# Altium schematic sheet Sheet2.SchDoc
size A4; SheetNumber: 2; SheetTotal: 3
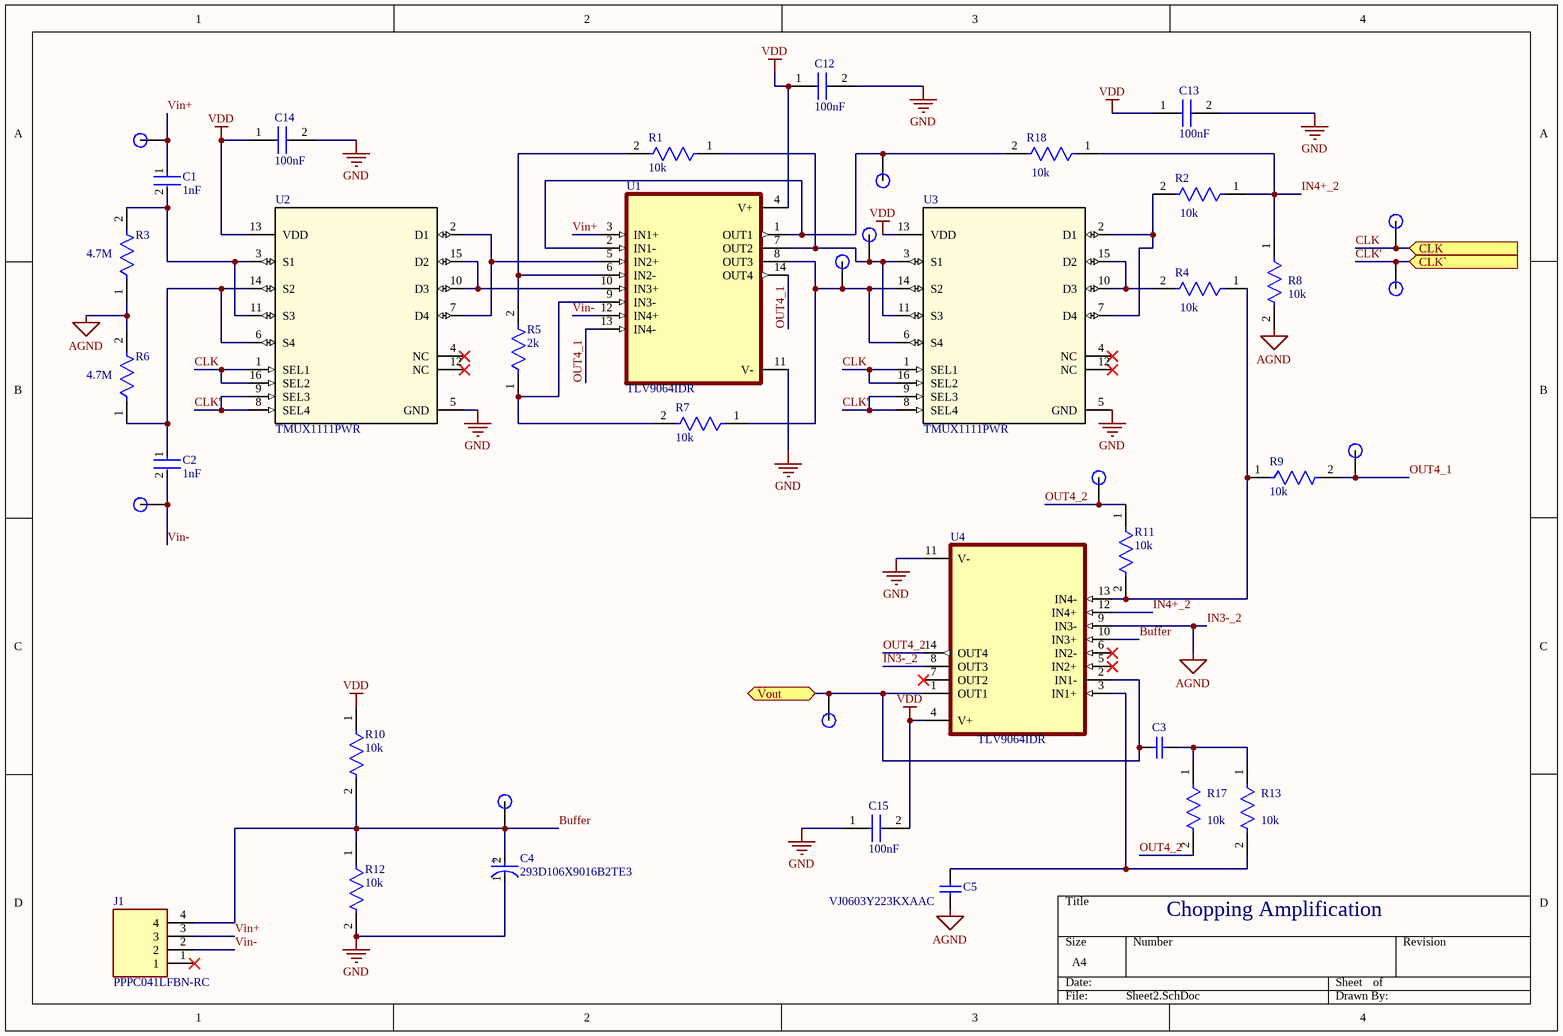
[diagram p0: Sheet2.SchDoc]

## Parts
C1  1nF  [FP-CC0603-DA-MFG]
C2  1nF  [FP-CC0603-DA-MFG]
C3  VJ0603Y473KXAAC  [CAPC1608X92X38NL15T08]  (value not drawn)
C4  293D106X9016B2TE3  [FP-293D-B-MFG]
C5  VJ0603Y223KXAAC  [CAPC1608X92X38ML15T08]
C12  100nF  [CAPC1005X55N]
C13  100nF  [CAPC1005X55N]
C14  100nF  [CAPC1005X55N]
C15  100nF  [CAPC1005X55N]
J1  PPPC041LFBN-RC  [RHDR4W80P0X254_1X4_1066X254X850P]
R1  10k  [FP-AC0603-IPC_A]
R2  10k  [FP-AC0603-IPC_A]
R3  4.7M  [FP-ESR03-MFG]
R4  10k  [FP-AC0603-IPC_A]
R5  2k  [FP-RN732A-MFG]
R6  4.7M  [FP-ESR03-MFG]
R7  10k  [FP-AC0603-IPC_A]
R8  10k  [FP-AC0603-IPC_A]
R9  10k  [FP-AC0603-IPC_A]
R10  10k  [FP-AC0603-IPC_A]
R11  10k  [FP-AC0603-IPC_A]
R12  10k  [FP-AC0603-IPC_A]
R13  10k  [FP-AC0603-IPC_A]
R17  10k  [FP-AC0603-IPC_A]
R18  10k  [FP-AC0603-IPC_A]
TP1  Test_Point  [Test_Point-Footprint-1]  (value not drawn)
TP2  Test_Point  [Test_Point-Footprint-1]  (value not drawn)
TP3  Test_Point  [Test_Point-Footprint-1]  (value not drawn)
TP4  Test_Point  [Test_Point-Footprint-1]  (value not drawn)
TP5  Test_Point  [Test_Point-Footprint-1]  (value not drawn)
TP6  Test_Point  [Test_Point-Footprint-1]  (value not drawn)
TP7  Test_Point  [Test_Point-Footprint-1]  (value not drawn)
TP8  Test_Point  [Test_Point-Footprint-1]  (value not drawn)
TP9  Test_Point  [Test_Point-Footprint-1]  (value not drawn)
TP10  Test_Point  [Test_Point-Footprint-1]  (value not drawn)
TP11  Test_Point  [Test_Point-Footprint-1]  (value not drawn)
U1  TLV9064IDR  [SOIC127P600X175-14N]
U2  TMUX1111PWR  [PW0016A_N]
U3  TMUX1111PWR  [PW0016A_N]
U4  TLV9064IDR  [SOIC127P600X175-14N]

## Ports
CLK (in), CLK` (in), Vout (bidir)

## Nets
GND: C4.1(C) C12.2 C13.2 C14.2 C15.1 R12.2 U1.11(V-) U2.5(GND) U3.5(GND) U4.11(V-)
IN3-_2: C5.1 R3.1 R6.2 R8.2 U4.8(OUT3) U4.9(IN3-)  [also labelled AGND]
VDD: C12.1 C13.1 C14.1 C15.2 R10.1 U1.4(V+) U2.13(VDD) U3.13(VDD) U4.4(V+)
Buffer: C4.2(A) J1.4 R10.2 R12.1 TP11.1 U4.10(IN3+)
CLK: TP3.1 U2.1(SEL1) U2.16(SEL2) U3.1(SEL1) U3.16(SEL2) ; port CLK
CLK': TP4.1 U2.8(SEL4) U2.9(SEL3) U3.8(SEL4) U3.9(SEL3) ; port CLK`
IN4+_2: R2.1 R8.1 R18.1 U4.12(IN4+)
OUT4_1: R9.2 TP7.1 U1.13(IN4-) U1.14(OUT4)
OUT4_2: R11.1 R17.2 TP9.1 U4.14(OUT4)
Vin+: C1.1 J1.3 TP1.1 U1.3(IN1+)
Vin-: C2.2 J1.2 TP8.1 U1.12(IN4+)
Vout: C3.2 TP10.1 U4.1(OUT1) U4.2(IN1-) ; port Vout
NetC1_2: C1.2 R3.2 U2.3(S1) U2.11(S3)
NetC2_1: C2.1 R6.1 U2.6(S4) U2.14(S2)
NetC3_1: C3.1 R13.1 R17.1
NetC5_2: C5.2 R13.2 U4.3(IN1+)
NetR1_1: R1.1 TP5.1 U1.7(OUT2) U3.3(S1) U3.11(S3)
NetR1_2: R1.2 R5.2 U1.6(IN2-)
NetR2_2: R2.2 U3.2(D1) U3.7(D4)
NetR4_1: R4.1 R9.1 R11.2 U4.13(IN4-)
NetR4_2: R4.2 U3.10(D3) U3.15(D2)
NetR5_1: R5.1 R7.2 U1.9(IN3-)
NetR7_1: R7.1 TP6.1 U1.8(OUT3) U3.6(S4) U3.14(S2)
NetR18_2: R18.2 TP2.1 U1.1(OUT1) U1.2(IN1-)
NetU1_5: U1.5(IN2+) U2.2(D1) U2.7(D4)
NetU1_10: U1.10(IN3+) U2.10(D3) U2.15(D2)

Not connected (* = marked no-connect by the designer): J1 1*; U2 4(NC)* 12(NC)*; U3 4(NC)* 12(NC)*; U4 5(IN2+)* 6(IN2-)* 7(OUT2)*

## Notes on the sheet
- Chopping Amplification
- (in symbol CMP-02414-000004-1) +

## Library data of the parts
C1 C2 = CMP-03422-000958-1: CC0603 1.0 nF X7R 10.00% 50 V; Manufacturer: YAGEO; Manufacturer Part Number: CC0603KPX7R9BB102; Temperature Coefficient: 15%; Voltage: 50 V; Tolerance: 0.1; Value: 1.0 nF; Material: Ceramic; Device Class L3: Ceramic Capacitors; Temperature Range Low: -55°C; Footprint Url: http://www.yageo.com/exep/pages/download/literatures/UPY-C_GEN_24.pdf; Category: Cap; RoHS: TRUE; Package: CC0603-DA; ComponentLink2URL: http://www.yageo.com/documents/recent/UPY-GPHC_X7R_6.3V-to-50V_18.pdf; Voltage Rating: 50 V; Automotive: No; Height: 0.9mm; Octopart: https://octopart.com/cc0603kpx7r9bb102-yageo-21769905; Temperature Range High: +125°C; ComponentLink2Description: Datasheet; Mouser Description: Multilayer Ceramic Capacitors MLCC - SMD/SMT 1.0nF 50V X7R 10%; Device Class L1: Passive Components; Temperature Characteristic: X7R; Temperature: -55°C to +125°C; Lead Free: Yes; Device Class L2: Capacitors; Capacitance: 1.0 nF
C3 = CMP-2006-01132-1: Manufacturer: Vitramon; Part Number: VJ0603Y473KXAAC
C4 = CMP-02414-000004-1: CAP TANT 10UF 10% 16V 1411; ESR (Equivalent Series Resistance): 2R; Polarity: Polar; Q Factor: 6; Ripple Current: 160mA; Dielectric Material: Tantalum; Leakage Current: 1.6uA; Dissipation Factor: 6%; Voltage Rating (DC): 16V; Case Code (Metric): 3528; Min Operating Temperature: -55°C; Mount: Surface Mount; Height: 1.9mm; Series: TANTAMOUNT® 293D; Width: 0.11inch; Termination: SMD/SMT; Length: 3.5mm; Voltage Rating: 16V; Packaging: Tape and Reel; Voltage: 16V; Height - Seated (Max): 0.083inch; Features: General Purpose; Case Code (Imperial): 1411; Max Operating Temperature: 125°C; Capacitance: 10uF; RoHS Compliant: Yes; Radiation Hardening: No; Case/Package: 1411; Construction: Flat; Lead Free: Lead Free; Depth: 2.8mm; Package Quantity: 1; Tolerance: 10%
C5 = CMP-2006-01144-1: Manufacturer: Vitramon; Part Number: VJ0603Y223KXAAC
C12-C15 = CL05B104KO5NNNC: Capacitor; Manufacturer_Name: SAMSUNG; Datasheet Link: https://datasheet.datasheetarchive.com/originals/distributors/Datasheets-DGA10/2408147.pdf; Height: 0.55mm; Manufacturer_Part_Number: CL05B104KO5NNNC; Mouser Part Number: 187-CL05B104KO5NNNC; Mouser Price/Stock: https://www.mouser.co.uk/ProductDetail/Samsung-Electro-Mechanics/CL05B104KO5NNNC?qs=hqM3L16%252BxlfT2SKOuAUq6Q%3D%3D; Arrow Part Number: CL05B104KO5NNNC; Arrow Price/Stock: https://www.arrow.com/en/products/cl05b104ko5nnnc/samsung-electro-mechanics.html?utm_currency=USD&region=europe
J1 = PPPC041LFBN-RC: Connector; Manufacturer_Name: Sullins; Datasheet Link: https://drawings-pdf.s3.amazonaws.com/10492.pdf; Height: 8.5mm; Manufacturer_Part_Number: PPPC041LFBN-RC
R1 R2 R4 R7-R13 R17 R18 = CMP-03412-040683-1: RES 10kΩ 5.00% 0.2W 0603
R3 R6 = CMP-08839-028186-1: 4.7MΩ ±1% 0.25W 0603 Anti-Surge Chip Resistor AEC-Q200; Temperature Coefficient: 100ppm/°C; Resistance: 4.7MR; Max Power Dissipation: 250mW; Max Operating Temperature: 155°C; Resistor Type: Thick Film; Tolerance: 1%; Features: Automotive AEC-Q200; Case/Package: 0603; Number of Terminations: 2; Series: ESR; RoHS Compliant: Yes; Packaging: Tape and Reel; Min Operating Temperature: -55°C
R5 = CMP-04015-025759-1: 2kΩ ±0.1% 0.1W, 1/10W Chip Resistor 0805 (2012 Metric) Moisture Resistant Thin Film; Power Rating: 100mW; Temperature Coefficient: 25ppm/°C; Voltage Rating: 100V; Resistance: 2kR; Min Operating Temperature: -55°C; Weight: 0.000194oz; Case/Package: 0805; Tolerance: 0.1%; Packaging: Tape and Reel; Max Operating Temperature: 125°C; Length: 2mm; Termination: SMD/SMT; Width: 1.2mm; Voltage Rating (DC): 100V; Height: 0.5mm; Composition: Thin Film; Case Code (Imperial): 0805; Case Code (Metric): 2012
TP1-TP11 = CMP-00030-00001-2
U1 U4 = TLV9064IDR: Quad, 5.5-V, 10-MHz, RRIO operational amplifier for cost-optimized applications; MF: Texas Instruments; SnapEDA_Link: https://www.snapeda.com/parts/TLV9064IDR/Texas+Instruments/view-part/?ref=snap; Package: SOIC-14 Texas Instruments; Value: *; MP: TLV9064IDR; Check_prices: https://www.snapeda.com/parts/TLV9064IDR/Texas+Instruments/view-part/?ref=eda
U2 U3 = TMUX1111PWR: 3-pA on-state leakage current, 5-V, 1:1 (SPST), 4-channel precision switch (4 active low) 16-TSSOP -40 to 125; Manufacturer_Name: Texas Instruments; TYPE: TYPE; RefDes: RefDes; Copyright: Copyright (C) 2026 Ultra Librarian. All rights reserved.; Manufacturer_Part_Number: TMUX1111PWR; Datasheet: https://www.ti.com/lit/gpn/tmux1111